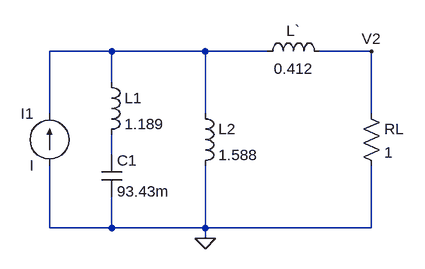
[diagram p0: schematic Ejercicio2.asc]
Ejercicio2.asc, the LTspice schematic file:
Version 4.1
SHEET 1 880 680
WIRE 224 112 128 112
WIRE 368 112 224 112
WIRE 464 112 368 112
WIRE 624 112 544 112
WIRE 224 160 224 112
WIRE 128 208 128 112
WIRE 368 208 368 112
WIRE 624 208 624 112
WIRE 224 272 224 240
WIRE 128 384 128 288
WIRE 224 384 224 336
WIRE 224 384 128 384
WIRE 368 384 368 288
WIRE 368 384 224 384
WIRE 624 384 624 288
WIRE 624 384 368 384
WIRE 368 400 368 384
FLAG 624 112 V2
FLAG 368 400 0
SYMBOL current 128 288 R180
WINDOW 0 24 80 Left 2
WINDOW 3 24 0 Left 2
SYMATTR InstName I1
SYMBOL ind 448 128 R270
WINDOW 0 32 56 VTop 2
WINDOW 3 5 56 VBottom 2
SYMATTR InstName L`
SYMATTR Value 0.412
SYMATTR SpiceLine Rser=1m
SYMBOL ind 208 144 R0
SYMATTR InstName L1
SYMATTR Value 1.189
SYMATTR SpiceLine Rser=1m
SYMBOL cap 208 272 R0
SYMATTR InstName C1
SYMATTR Value 93.43m
SYMBOL ind 352 192 R0
SYMATTR InstName L2
SYMATTR Value 1.588
SYMATTR SpiceLine Rser=1m
SYMBOL res 608 192 R0
SYMATTR InstName RL
SYMATTR Value 1

The netlist it stands for:
* Ejercicio2.asc
I1 0 N001 I
L` N001 V2 0.412 Rser=1m
L1 N001 N002 1.189 Rser=1m
C1 N002 0 93.43m
L2 N001 0 1.588 Rser=1m
RL V2 0 1
.backanno
.end